# Altium project keyboard_V0.PrjPcb
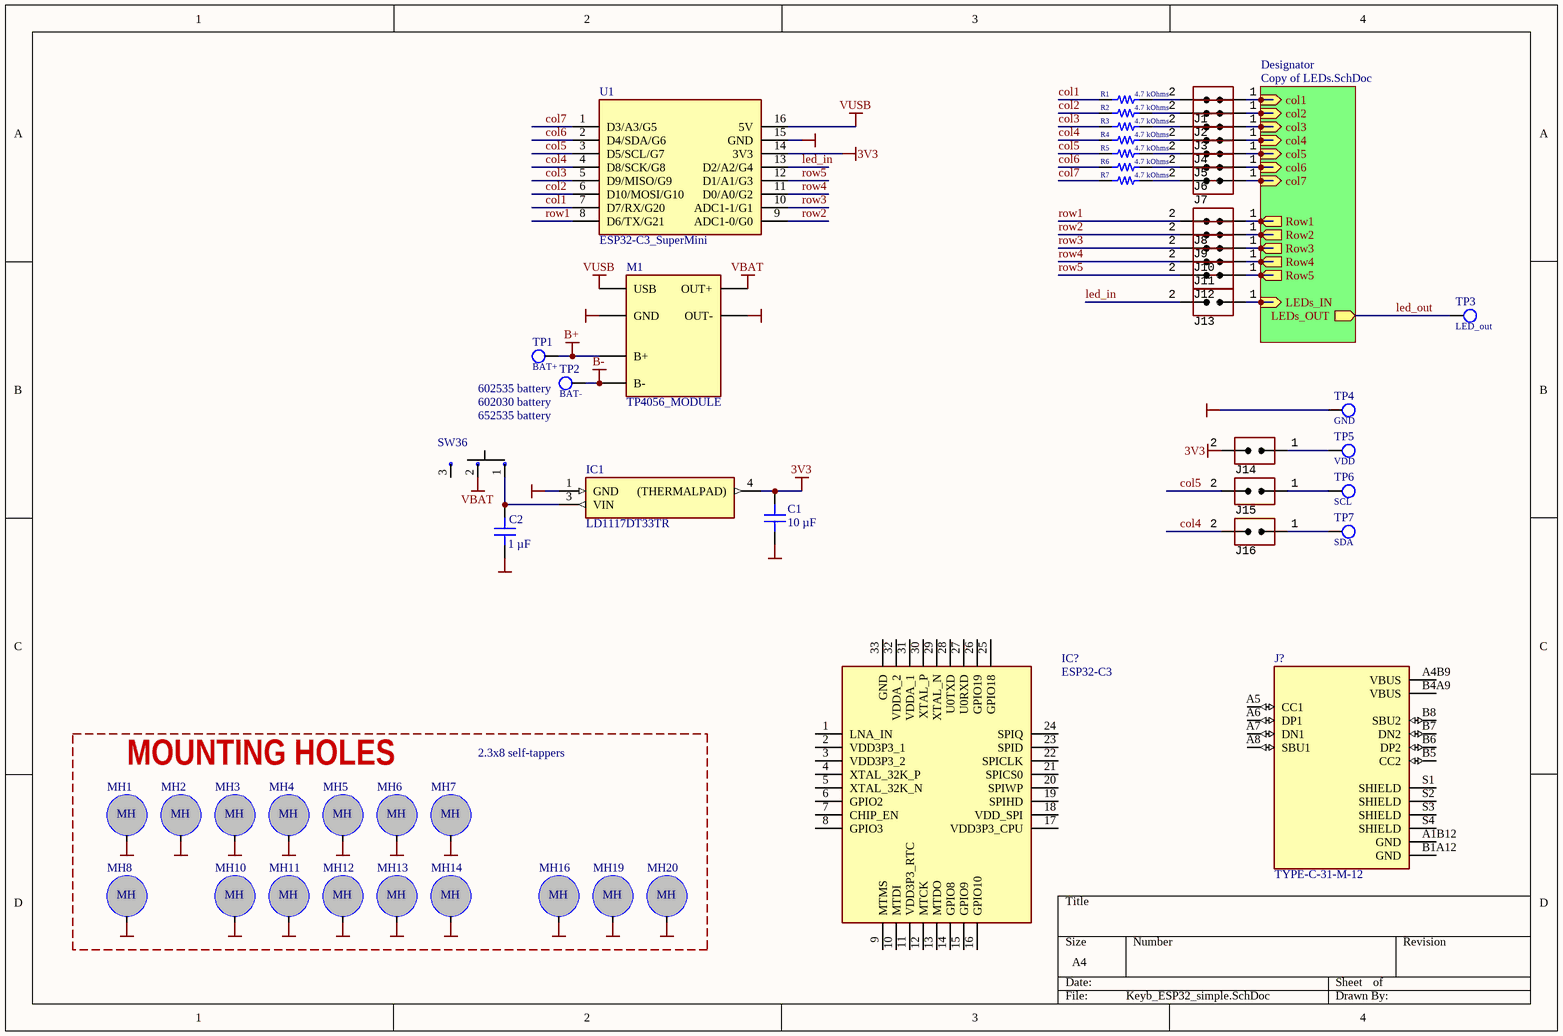
[diagram p0: Keyb_ESP32_simple.SchDoc]
2 sheets, 134 parts. Net scope: hierarchical (ports join the sheet entries above them; power ports are global).
Board file: Keyb_ESP32_simple.PcbDoc
Sheets:
  Keyb_ESP32_simple.SchDoc
    Designator = Copy of LEDs.SchDoc

## Sheet Keyb_ESP32_simple.SchDoc
size A4; SheetNumber: 1; SheetTotal: 2

### Parts
C1  10 µF  [CAP 0805_2012]
C2  1 µF  [CAP 0805_2012]
IC1  LD1117DT33TR  [TO228P972X240-3N]
IC?  ESP32-C3  [QFN50P500X500X90-33N-D]
J1  (no value)  [CON: JUMPER x1]
J2  (no value)  [CON: JUMPER x1]
J3  (no value)  [CON: JUMPER x1]
J4  (no value)  [CON: JUMPER x1]
J5  (no value)  [CON: JUMPER x1]
J6  (no value)  [CON: JUMPER x1]
J7  (no value)  [CON: JUMPER x1]
J8  (no value)  [CON: JUMPER x1]
J9  (no value)  [CON: JUMPER x1]
J10  (no value)  [CON: JUMPER x1]
J11  (no value)  [CON: JUMPER x1]
J12  (no value)  [CON: JUMPER x1]
J13  (no value)  [CON: JUMPER x1]
J14  (no value)  [CON: JUMPER x1]
J15  (no value)  [CON: JUMPER x1]
J16  (no value)  [CON: JUMPER x1]
J?  TYPE-C-31-M-12  [HRO_TYPE-C-31-M-12]
M1  TP4056_MODULE  [TP4056_MODULE]
MH1  MountingHole  [Hole_2.5mm]  (value not drawn)
MH2  MountingHole  [Hole_2.5mm]  (value not drawn)
MH3  MountingHole  [Hole_2.5mm]  (value not drawn)
MH4  MountingHole  [Hole_2.5mm]  (value not drawn)
MH5  MountingHole  [Hole_2.5mm]  (value not drawn)
MH6  MountingHole  [Hole_2.5mm]  (value not drawn)
MH7  MountingHole  [Hole_2.5mm]  (value not drawn)
MH8  MountingHole  [Hole_2.5mm]  (value not drawn)
MH10  MountingHole  [Hole_2.5mm]  (value not drawn)
MH11  MountingHole  [Hole_2.5mm]  (value not drawn)
MH12  MountingHole  [Hole_2.5mm]  (value not drawn)
MH13  MountingHole  [Hole_2.5mm]  (value not drawn)
MH14  MountingHole  [Hole_2.5mm]  (value not drawn)
MH16  MountingHole  [Hole_2.5mm]  (value not drawn)
MH19  MountingHole  [Hole_2.5mm]  (value not drawn)
MH20  MountingHole  [Hole_2.5mm]  (value not drawn)
R1  4.7 kOhms  [RES 0603_1608]
R2  4.7 kOhms  [RES 0603_1608]
R3  4.7 kOhms  [RES 0603_1608]
R4  4.7 kOhms  [RES 0603_1608]
R5  4.7 kOhms  [RES 0603_1608]
R6  4.7 kOhms  [RES 0603_1608]
R7  4.7 kOhms  [RES 0603_1608]
SW36  RockerSwitch_3mm  [SLIDE_SW_BIG]  (value not drawn)
TP1  BAT+  [TESTPOINT_PAD]
TP2  BAT-  [TESTPOINT_PAD]
TP3  LED_out  [TESTPOINT_PAD]
TP4  GND  [TESTPOINT_PAD]
TP5  VDD  [TESTPOINT_PAD]
TP6  SCL  [TESTPOINT_PAD]
TP7  SDA  [TESTPOINT_PAD]
U1  ESP32-C3_SuperMini  [ESP32-C3_SUPER_MINI]

### Blocks framed on the sheet
MOUNTING HOLES: MH1-MH8 MH10-MH14 MH16 MH19 MH20

### Sub-sheets
Designator = Copy of LEDs.SchDoc: col1 (in), col4 (in), col2 (in), col7 (in), col5 (in), col3 (in), col6 (in), Row5 (out), Row1 (out), Row2 (out), Row3 (out), Row4 (out), LEDs_IN (in), LEDs_OUT (out)

### Nets
3V3: C1.2 IC1.4((THERMALPAD)) J14.2(IN) U1.14(3V3)
B+: M1.B+ TP1.1
B-: M1.B- TP2.1
GND: C1.1 C2.1 IC1.1(GND) M1.GND M1.OUT- MH1.0 MH2.0 MH3.0 MH4.0 MH5.0 MH6.0 MH7.0 MH8.0 MH10.0 MH11.0 MH12.0 MH13.0 MH14.0 MH16.0 MH19.0 MH20.0 TP4.1 U1.15(GND)
VBAT: M1.OUT+ SW36.2
VUSB: M1.USB U1.16(5V)
col1: R1.2 U1.7(D7/RX/G20)
col2: R2.2 U1.6(D10/MOSI/G10)
col3: R3.2 U1.5(D9/MISO/G9)
col4: J16.2(IN) R4.2 U1.4(D8/SCK/G8)
col5: J15.2(IN) R5.2 U1.3(D5/SCL/G7)
col6: R6.2 U1.2(D4/SDA/G6)
col7: R7.2 U1.1(D3/A3/G5)
led_in: J13.2(IN) U1.13(D2/A2/G4)
led_out: TP3.1 ; sheet Designator/LEDs_OUT
row1: J8.2(IN) U1.8(D6/TX/G21)
row2: J9.2(IN) U1.9(ADC1-0/G0)
row3: J10.2(IN) U1.10(ADC1-1/G1)
row4: J11.2(IN) U1.11(D0/A0/G2)
row5: J12.2(IN) U1.12(D1/A1/G3)
NetC2_2: C2.2 IC1.3(VIN) SW36.1
NetD1_1: J8.1(IN) ; sheet Designator/Row1
NetD8_1: J9.1(IN) ; sheet Designator/Row2
NetD15_1: J10.1(IN) ; sheet Designator/Row3
NetD22_1: J11.1(IN) ; sheet Designator/Row4
NetD29_1: J12.1(IN) ; sheet Designator/Row5
NetJ1_1: J1.1(IN) ; sheet Designator/col1
NetJ1_2: J1.2(IN) R1.1
NetJ2_1: J2.1(IN) ; sheet Designator/col2
NetJ2_2: J2.2(IN) R2.1
NetJ3_1: J3.1(IN) ; sheet Designator/col3
NetJ3_2: J3.2(IN) R3.1
NetJ4_1: J4.1(IN) ; sheet Designator/col4
NetJ4_2: J4.2(IN) R4.1
NetJ5_1: J5.1(IN) ; sheet Designator/col5
NetJ5_2: J5.2(IN) R5.1
NetJ6_1: J6.1(IN) ; sheet Designator/col6
NetJ6_2: J6.2(IN) R6.1
NetJ7_1: J7.1(IN) ; sheet Designator/col7
NetJ7_2: J7.2(IN) R7.1
NetJ13_1: J13.1(IN) ; sheet Designator/LEDs_IN
NetJ14_1: J14.1(IN) TP5.1
NetJ15_1: J15.1(IN) TP6.1
NetJ16_1: J16.1(IN) TP7.1

Not connected (* = marked no-connect by the designer): IC? 1(LNA_IN) 2(VDD3P3_1) 3(VDD3P3_2) 4(XTAL_32K_P) 5(XTAL_32K_N) 6(GPIO2) 7(CHIP_EN) 8(GPIO3) 9(MTMS) 10(MTDI) 11(VDD3P3_RTC) 12(MTCK) 13(MTDO) 14(GPIO8) 15(GPIO9) 16(GPIO10) 17(VDD3P3_CPU) 18(VDD_SPI) 19(SPIHD) 20(SPIWP) 21(SPICS0) 22(SPICLK) 23(SPID) 24(SPIQ) 25(GPIO18) 26(GPIO19) 27(U0RXD) 28(U0TXD) 29(XTAL_N) 30(XTAL_P) 31(VDDA_1) 32(VDDA_2) 33(GND); J? A1B12(GND) A4B9(VBUS) A5(CC1) A6(DP1) A7(DN1) A8(SBU1) B1A12(GND) B4A9(VBUS) B5(CC2) B6(DP2) B7(DN2) B8(SBU2) S1(SHIELD) S2(SHIELD) S3(SHIELD) S4(SHIELD); SW36 3

### Notes on the sheet
- (near TP2) 602535 battery
- (near TP2) 602030 battery
- 652535 battery
- 2.3x8 self-tappers
- (in symbol MountingHole) MH

### Library data of the parts
C1 = C0805C106K8PAC7800: CAP CER 10UF 10V X5R 0805; manufacturer: KEMET; Tolerance: ±10%; Part Number: C0805C106K8PAC7800; Value: 10 µF; Applications: Bypass, Decoupling; Capacitance: 10 µF; componentlink1description: Datasheet; componentlink1url: https://connect.kemet.com:7667/gateway/IntelliData-ComponentDocumentation/1.0/download/datasheet/C0805C106K8PACTU; componentlink2description: DigiKey Link; componentlink2url: https://www.digikey.com/en/products/detail/kemet/C0805C106K8PAC7800/1090830; Device Package: 0805 (2012 Metric); lastupdated: 9/14/2022 7:51:56 AM; Lifecycle Status: Active; Minimum Order: 1; Mounting Type: Surface Mount, MLCC; Operating Temperature: -55°C ~ 85°C; Package / Case: 0805 (2012 Metric); packaging: TapeAndReel; partid: 44790; Part Status: Active; price: 0.02; series: SMD Comm X5R; Size / Dimension: 0.079" L x 0.049" W (2.00mm x 1.25mm); Supplier 1: DigiKey; Supplier Part Number 1: 399-C0805C106K8PAC7800CT-ND; Temperature Coefficient: X5R; Thickness (Max): 0.055" (1.40mm); Voltage - Rated: 10V
C2 = C0805C105K4RAC7800: CAP CER 1UF 16V X7R 0805; manufacturer: KEMET; Tolerance: ±10%; Part Number: C0805C105K4RAC7800; Value: 1 µF; Applications: Bypass, Decoupling; Capacitance: 1 µF; componentlink1description: Datasheet; componentlink1url: https://api.kemet.com/component-edge/download/datasheet/C0805C105K4RACTU.pdf; componentlink2description: DigiKey Link; componentlink2url: https://www.digikey.com/en/products/detail/kemet/C0805C105K4RAC7800/416047; Device Package: 0805 (2012 Metric); lastupdated: 9/19/2022 1:03:30 PM; Lifecycle Status: Active; Minimum Order: 1; Mounting Type: Surface Mount, MLCC; Operating Temperature: -55°C ~ 125°C; Package / Case: 0805 (2012 Metric); packaging: TapeAndReel; partid: 32075; Part Status: Active; price: 0.01; series: SMD Comm X7R; Size / Dimension: 0.079" L x 0.049" W (2.00mm x 1.25mm); Supplier 1: DigiKey; Supplier Part Number 1: 399-C0805C105K4RAC7800CT-ND; Temperature Coefficient: X7R; Thickness (Max): 0.039" (1.00mm); Voltage - Rated: 16V
IC1 = LD1117DT33TR: Integrated Circuit; Manufacturer_Name: STMicroelectronics; Datasheet Link: http://www.st.com/web/en/resource/technical/document/datasheet/CD00000544.pdf; Height: 2.4mm; Manufacturer_Part_Number: LD1117DT33TR; Mouser Part Number: 511-LD1117DT33-TR; Mouser Price/Stock: https://www.mouser.co.uk/ProductDetail/STMicroelectronics/LD1117DT33TR?qs=4JhUBQGAOSd4P5jVYGxp2g%3D%3D; Arrow Part Number: LD1117DT33TR; Arrow Price/Stock: https://www.arrow.com/en/products/ld1117dt33tr/stmicroelectronics?region=nac
IC? = ESP32-C3: Integrated Circuit; Manufacturer_Name: Espressif Systems; Datasheet Link: https://www.espressif.com/sites/default/files/documentation/esp32-c3_datasheet_en.pdf; Height: 0.9mm; Manufacturer_Part_Number: ESP32-C3; Mouser Part Number: 356-ESP32-C3; Mouser Price/Stock: https://www.mouser.co.uk/ProductDetail/Espressif-Systems/ESP32-C3?qs=iLbezkQI%252BsiMXe7tMG%252Bo%2FA%3D%3D
J1-J16 = Jumper_single: CommentText: "Перемычка"
J? = TYPE-C-31-M-12: USB Connectors 24 Receptacle 1 8.94*7.3mm RoHS; MF: {'manufacturer': u'HRO Electronics Co., Ltd.'}; Package: None; Price: None; Value: *; MP: TYPE-C-31-M-12; Availability: Unavailable
R1-R7 = ERJ-U03J472V: RES 4.7K OHM 5% 1/10W 0603 SMD; Manufacturer: Panasonic Electronic Components; Power (Watts): 0.1W, 1/10W; Temperature Coefficient: ±200ppm/°C; Part Number: ERJ-U03J472V; Value: 4.7 kOhms; ComponentLink1Description: Datasheet; ComponentLink1URL: https://industrial.panasonic.com/cdbs/www-data/pdf/RDP0000/AOA0000C334.pdf; ComponentLink2Description: DigiKey Link; ComponentLink2URL: https://www.digikey.com/en/products/detail/panasonic-electronic-components/ERJ-U03J472V/11631906; Composition: Thick Film; Device Package: 0603 (1608 Metric); Features: Anti-Sulfur, Automotive AEC-Q200; Height - Seated (Max): 0.022" (0.55mm); LastUpdated: 2/9/2024 8:41:20 PM; Lifecycle Status: Active; Minimum Order: 1; Number of Terminations: 2; Operating Temperature: -55°C ~ 155°C; Package / Case: 0603 (1608 Metric); Packaging: TapeAndReel; PartId: 62126; Part Status: Active; Price: 0.01; Ratings: AEC-Q200; Resistance: 4.7 kOhms; Series: ERJ-U03; Size / Dimension: 0.063" L x 0.031" W (1.60mm x 0.80mm); Supplier 1: DigiKey; Supplier Part Number 1: 10-ERJ-U03J472VCT-ND; Supplier Device Package: 0603; Tolerance: ±5%
SW36 = RockerSwitch_3mm: Slide switch L-KLS7-SS-12F19-G5
TP1-TP7 = TestPoint

## Sheet Copy of LEDs.SchDoc
size A2; SheetNumber: 2; SheetTotal: 2
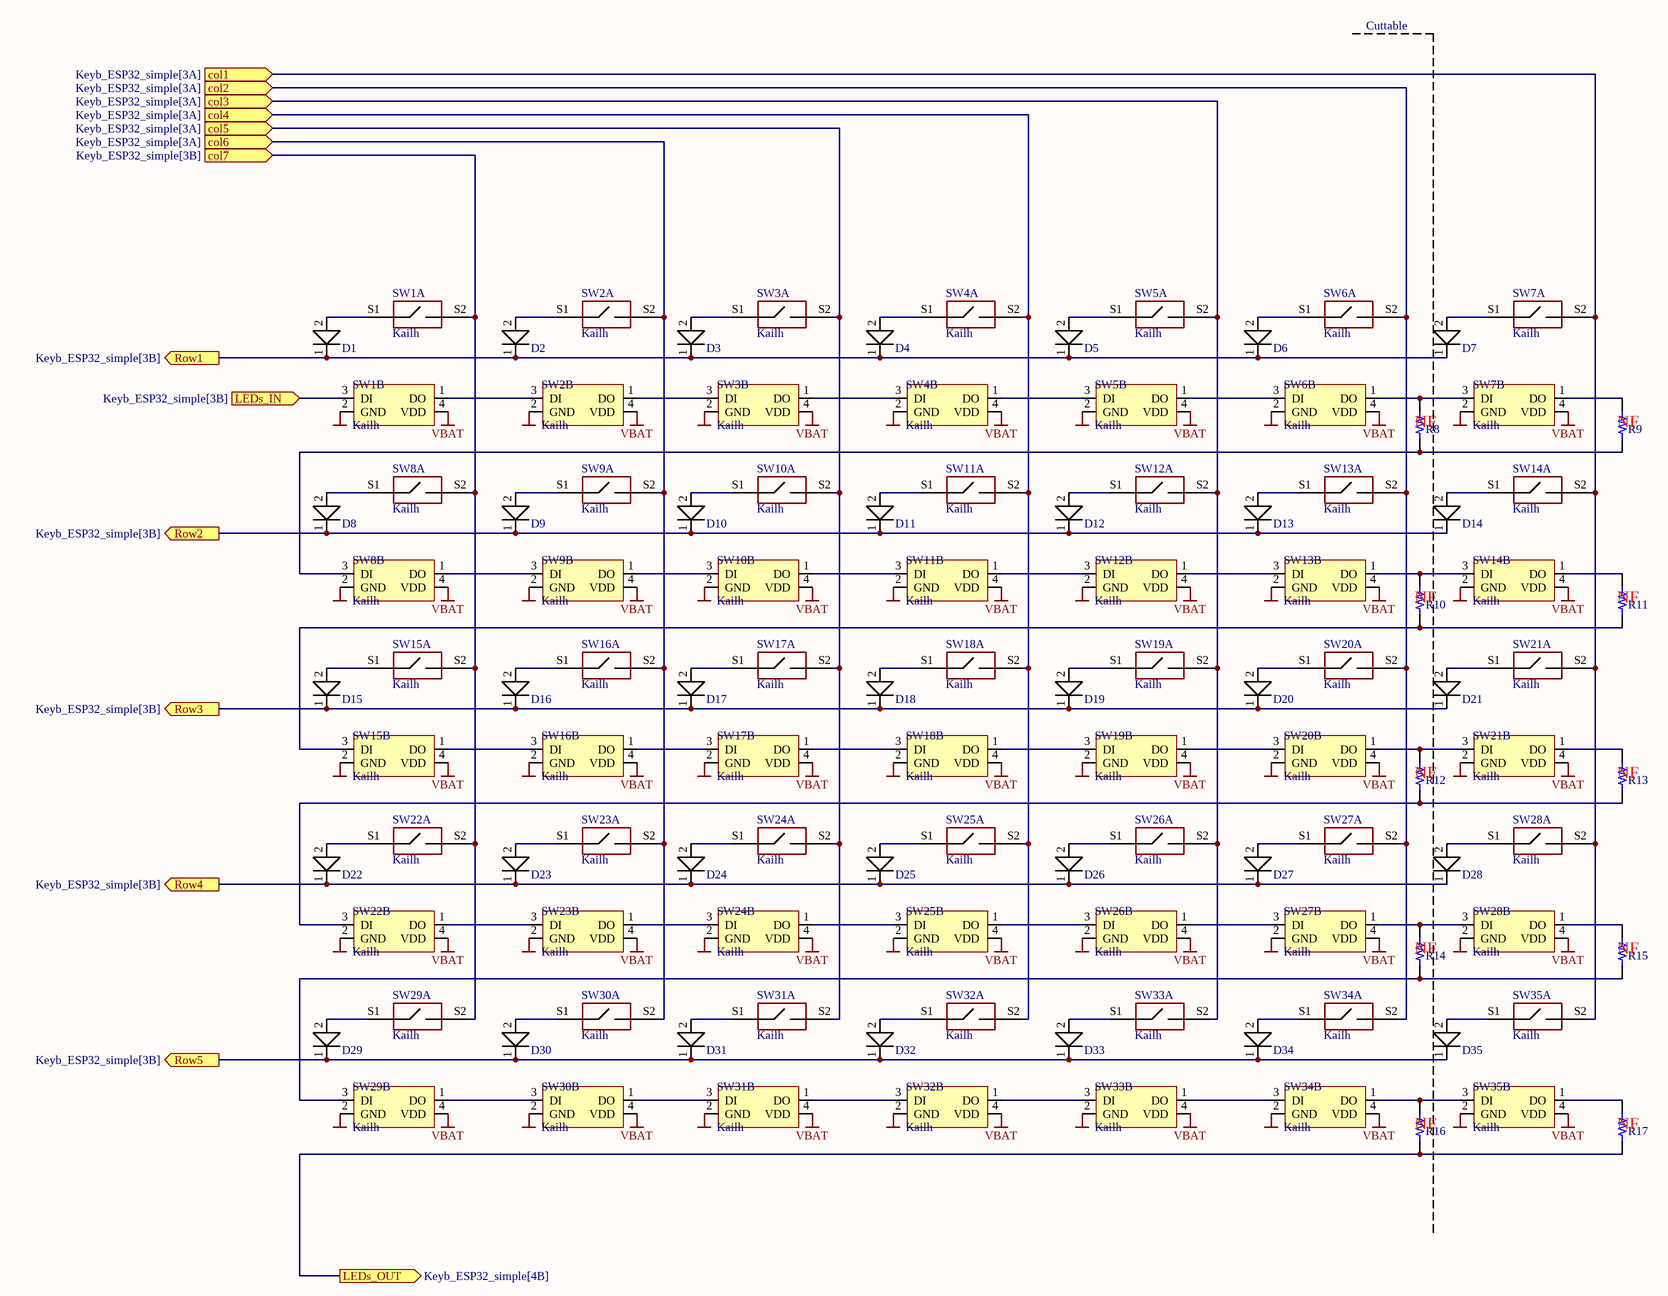
[diagram p1: Copy of LEDs.SchDoc]

### Parts
D1  1N4148  [SOD-123]  (value not drawn)
D2  1N4148  [SOD-123]  (value not drawn)
D3  1N4148  [SOD-123]  (value not drawn)
D4  1N4148  [SOD-123]  (value not drawn)
D5  1N4148  [SOD-123]  (value not drawn)
D6  1N4148  [SOD-123]  (value not drawn)
D7  1N4148  [SOD-123]  (value not drawn)
D8  1N4148  [SOD-123]  (value not drawn)
D9  1N4148  [SOD-123]  (value not drawn)
D10  1N4148  [SOD-123]  (value not drawn)
D11  1N4148  [SOD-123]  (value not drawn)
D12  1N4148  [SOD-123]  (value not drawn)
D13  1N4148  [SOD-123]  (value not drawn)
D14  1N4148  [SOD-123]  (value not drawn)
D15  1N4148  [SOD-123]  (value not drawn)
D16  1N4148  [SOD-123]  (value not drawn)
D17  1N4148  [SOD-123]  (value not drawn)
D18  1N4148  [SOD-123]  (value not drawn)
D19  1N4148  [SOD-123]  (value not drawn)
D20  1N4148  [SOD-123]  (value not drawn)
D21  1N4148  [SOD-123]  (value not drawn)
D22  1N4148  [SOD-123]  (value not drawn)
D23  1N4148  [SOD-123]  (value not drawn)
D24  1N4148  [SOD-123]  (value not drawn)
D25  1N4148  [SOD-123]  (value not drawn)
D26  1N4148  [SOD-123]  (value not drawn)
D27  1N4148  [SOD-123]  (value not drawn)
D28  1N4148  [SOD-123]  (value not drawn)
D29  1N4148  [SOD-123]  (value not drawn)
D30  1N4148  [SOD-123]  (value not drawn)
D31  1N4148  [SOD-123]  (value not drawn)
D32  1N4148  [SOD-123]  (value not drawn)
D33  1N4148  [SOD-123]  (value not drawn)
D34  1N4148  [SOD-123]  (value not drawn)
D35  1N4148  [SOD-123]  (value not drawn)
R8  (no value)  [RES 0603_1608]
R9  (no value)  [RES 0603_1608]
R10  (no value)  [RES 0603_1608]
R11  (no value)  [RES 0603_1608]
R12  (no value)  [RES 0603_1608]
R13  (no value)  [RES 0603_1608]
R14  (no value)  [RES 0603_1608]
R15  (no value)  [RES 0603_1608]
R16  (no value)  [RES 0603_1608]
R17  (no value)  [RES 0603_1608]
SW1  Kailh  [KAILH_MX_SOCKET_WS2812]  (parts A,B of 2)
SW2  Kailh  [KAILH_MX_SOCKET_WS2812]  (parts A,B of 2)
SW3  Kailh  [KAILH_MX_SOCKET_WS2812]  (parts A,B of 2)
SW4  Kailh  [KAILH_MX_SOCKET_WS2812]  (parts A,B of 2)
SW5  Kailh  [KAILH_MX_SOCKET_WS2812]  (parts A,B of 2)
SW6  Kailh  [KAILH_MX_SOCKET_WS2812]  (parts A,B of 2)
SW7  Kailh  [KAILH_MX_SOCKET_WS2812]  (parts A,B of 2)
SW8  Kailh  [KAILH_MX_SOCKET_WS2812]  (parts A,B of 2)
SW9  Kailh  [KAILH_MX_SOCKET_WS2812]  (parts A,B of 2)
SW10  Kailh  [KAILH_MX_SOCKET_WS2812]  (parts A,B of 2)
SW11  Kailh  [KAILH_MX_SOCKET_WS2812]  (parts A,B of 2)
SW12  Kailh  [KAILH_MX_SOCKET_WS2812]  (parts A,B of 2)
SW13  Kailh  [KAILH_MX_SOCKET_WS2812]  (parts A,B of 2)
SW14  Kailh  [KAILH_MX_SOCKET_WS2812]  (parts A,B of 2)
SW15  Kailh  [KAILH_MX_SOCKET_WS2812]  (parts A,B of 2)
SW16  Kailh  [KAILH_MX_SOCKET_WS2812]  (parts A,B of 2)
SW17  Kailh  [KAILH_MX_SOCKET_WS2812]  (parts A,B of 2)
SW18  Kailh  [KAILH_MX_SOCKET_WS2812]  (parts A,B of 2)
SW19  Kailh  [KAILH_MX_SOCKET_WS2812]  (parts A,B of 2)
SW20  Kailh  [KAILH_MX_SOCKET_WS2812]  (parts A,B of 2)
SW21  Kailh  [KAILH_MX_SOCKET_WS2812]  (parts A,B of 2)
SW22  Kailh  [KAILH_MX_SOCKET_WS2812]  (parts A,B of 2)
SW23  Kailh  [KAILH_MX_SOCKET_WS2812]  (parts A,B of 2)
SW24  Kailh  [KAILH_MX_SOCKET_WS2812]  (parts A,B of 2)
SW25  Kailh  [KAILH_MX_SOCKET_WS2812]  (parts A,B of 2)
SW26  Kailh  [KAILH_MX_SOCKET_WS2812]  (parts A,B of 2)
SW27  Kailh  [KAILH_MX_SOCKET_WS2812]  (parts A,B of 2)
SW28  Kailh  [KAILH_MX_SOCKET_WS2812]  (parts A,B of 2)
SW29  Kailh  [KAILH_MX_SOCKET_WS2812]  (parts A,B of 2)
SW30  Kailh  [KAILH_MX_SOCKET_WS2812]  (parts A,B of 2)
SW31  Kailh  [KAILH_MX_SOCKET_WS2812]  (parts A,B of 2)
SW32  Kailh  [KAILH_MX_SOCKET_WS2812]  (parts A,B of 2)
SW33  Kailh  [KAILH_MX_SOCKET_WS2812]  (parts A,B of 2)
SW34  Kailh  [KAILH_MX_SOCKET_WS2812]  (parts A,B of 2)
SW35  Kailh  [KAILH_MX_SOCKET_WS2812]  (parts A,B of 2)

### Ports
col1 (in, see Keyb_ESP32_simple[3A]), col2 (in, see Keyb_ESP32_simple[3A]), col3 (in, see Keyb_ESP32_simple[3A]), col4 (in, see Keyb_ESP32_simple[3A]), col5 (in, see Keyb_ESP32_simple[3A]), col6 (in, see Keyb_ESP32_simple[3A]), col7 (in, see Keyb_ESP32_simple[3B]), LEDs_IN (in, see Keyb_ESP32_simple[3B]), LEDs_OUT (out, see Keyb_ESP32_simple[4B]), Row1 (out, see Keyb_ESP32_simple[3B]), Row2 (out, see Keyb_ESP32_simple[3B]), Row3 (out, see Keyb_ESP32_simple[3B]), Row4 (out, see Keyb_ESP32_simple[3B]), Row5 (out, see Keyb_ESP32_simple[3B])

### Nets
GND: SW1.2(GND) SW2.2(GND) SW3.2(GND) SW4.2(GND) SW5.2(GND) SW6.2(GND) SW7.2(GND) SW8.2(GND) SW9.2(GND) SW10.2(GND) SW11.2(GND) SW12.2(GND) SW13.2(GND) SW14.2(GND) SW15.2(GND) SW16.2(GND) SW17.2(GND) SW18.2(GND) SW19.2(GND) SW20.2(GND) SW21.2(GND) SW22.2(GND) SW23.2(GND) SW24.2(GND) SW25.2(GND) SW26.2(GND) SW27.2(GND) SW28.2(GND) SW29.2(GND) SW30.2(GND) SW31.2(GND) SW32.2(GND) SW33.2(GND) SW34.2(GND) SW35.2(GND)
VBAT: SW1.4(VDD) SW2.4(VDD) SW3.4(VDD) SW4.4(VDD) SW5.4(VDD) SW6.4(VDD) SW7.4(VDD) SW8.4(VDD) SW9.4(VDD) SW10.4(VDD) SW11.4(VDD) SW12.4(VDD) SW13.4(VDD) SW14.4(VDD) SW15.4(VDD) SW16.4(VDD) SW17.4(VDD) SW18.4(VDD) SW19.4(VDD) SW20.4(VDD) SW21.4(VDD) SW22.4(VDD) SW23.4(VDD) SW24.4(VDD) SW25.4(VDD) SW26.4(VDD) SW27.4(VDD) SW28.4(VDD) SW29.4(VDD) SW30.4(VDD) SW31.4(VDD) SW32.4(VDD) SW33.4(VDD) SW34.4(VDD) SW35.4(VDD)
led_out: R16.2 R17.2 ; port LEDs_OUT
NetD1_1: D1.1(S8) D2.1(S8) D3.1(S8) D4.1(S8) D5.1(S8) D6.1(S8) D7.1(S8) ; port Row1
NetD1_2: D1.2(S7) SW1.S1
NetD2_2: D2.2(S7) SW2.S1
NetD3_2: D3.2(S7) SW3.S1
NetD4_2: D4.2(S7) SW4.S1
NetD5_2: D5.2(S7) SW5.S1
NetD6_2: D6.2(S7) SW6.S1
NetD7_2: D7.2(S7) SW7.S1
NetD8_1: D8.1(S8) D9.1(S8) D10.1(S8) D11.1(S8) D12.1(S8) D13.1(S8) D14.1(S8) ; port Row2
NetD8_2: D8.2(S7) SW8.S1
NetD9_2: D9.2(S7) SW9.S1
NetD10_2: D10.2(S7) SW10.S1
NetD11_2: D11.2(S7) SW11.S1
NetD12_2: D12.2(S7) SW12.S1
NetD13_2: D13.2(S7) SW13.S1
NetD14_2: D14.2(S7) SW14.S1
NetD15_1: D15.1(S8) D16.1(S8) D17.1(S8) D18.1(S8) D19.1(S8) D20.1(S8) D21.1(S8) ; port Row3
NetD15_2: D15.2(S7) SW15.S1
NetD16_2: D16.2(S7) SW16.S1
NetD17_2: D17.2(S7) SW17.S1
NetD18_2: D18.2(S7) SW18.S1
NetD19_2: D19.2(S7) SW19.S1
NetD20_2: D20.2(S7) SW20.S1
NetD21_2: D21.2(S7) SW21.S1
NetD22_1: D22.1(S8) D23.1(S8) D24.1(S8) D25.1(S8) D26.1(S8) D27.1(S8) D28.1(S8) ; port Row4
NetD22_2: D22.2(S7) SW22.S1
NetD23_2: D23.2(S7) SW23.S1
NetD24_2: D24.2(S7) SW24.S1
NetD25_2: D25.2(S7) SW25.S1
NetD26_2: D26.2(S7) SW26.S1
NetD27_2: D27.2(S7) SW27.S1
NetD28_2: D28.2(S7) SW28.S1
NetD29_1: D29.1(S8) D30.1(S8) D31.1(S8) D32.1(S8) D33.1(S8) D34.1(S8) D35.1(S8) ; port Row5
NetD29_2: D29.2(S7) SW29.S1
NetD30_2: D30.2(S7) SW30.S1
NetD31_2: D31.2(S7) SW31.S1
NetD32_2: D32.2(S7) SW32.S1
NetD33_2: D33.2(S7) SW33.S1
NetD34_2: D34.2(S7) SW34.S1
NetD35_2: D35.2(S7) SW35.S1
NetJ1_1: SW7.S2 SW14.S2 SW21.S2 SW28.S2 SW35.S2 ; port col1
NetJ2_1: SW6.S2 SW13.S2 SW20.S2 SW27.S2 SW34.S2 ; port col2
NetJ3_1: SW5.S2 SW12.S2 SW19.S2 SW26.S2 SW33.S2 ; port col3
NetJ4_1: SW4.S2 SW11.S2 SW18.S2 SW25.S2 SW32.S2 ; port col4
NetJ5_1: SW3.S2 SW10.S2 SW17.S2 SW24.S2 SW31.S2 ; port col5
NetJ6_1: SW2.S2 SW9.S2 SW16.S2 SW23.S2 SW30.S2 ; port col6
NetJ7_1: SW1.S2 SW8.S2 SW15.S2 SW22.S2 SW29.S2 ; port col7
NetJ13_1: SW1.3(DI) ; port LEDs_IN
NetR8_1: R8.1 SW6.1(DO) SW7.3(DI)
NetR8_2: R8.2 R9.2 SW8.3(DI)
NetR9_1: R9.1 SW7.1(DO)
NetR10_1: R10.1 SW13.1(DO) SW14.3(DI)
NetR10_2: R10.2 R11.2 SW15.3(DI)
NetR11_1: R11.1 SW14.1(DO)
NetR12_1: R12.1 SW20.1(DO) SW21.3(DI)
NetR12_2: R12.2 R13.2 SW22.3(DI)
NetR13_1: R13.1 SW21.1(DO)
NetR14_1: R14.1 SW27.1(DO) SW28.3(DI)
NetR14_2: R14.2 R15.2 SW29.3(DI)
NetR15_1: R15.1 SW28.1(DO)
NetR16_1: R16.1 SW34.1(DO) SW35.3(DI)
NetR17_1: R17.1 SW35.1(DO)
NetSW1_1: SW1.1(DO) SW2.3(DI)
NetSW2_1: SW2.1(DO) SW3.3(DI)
NetSW3_1: SW3.1(DO) SW4.3(DI)
NetSW4_1: SW4.1(DO) SW5.3(DI)
NetSW5_1: SW5.1(DO) SW6.3(DI)
NetSW8_1: SW8.1(DO) SW9.3(DI)
NetSW9_1: SW9.1(DO) SW10.3(DI)
NetSW10_1: SW10.1(DO) SW11.3(DI)
NetSW11_1: SW11.1(DO) SW12.3(DI)
NetSW12_1: SW12.1(DO) SW13.3(DI)
NetSW15_1: SW15.1(DO) SW16.3(DI)
NetSW16_1: SW16.1(DO) SW17.3(DI)
NetSW17_1: SW17.1(DO) SW18.3(DI)
NetSW18_1: SW18.1(DO) SW19.3(DI)
NetSW19_1: SW19.1(DO) SW20.3(DI)
NetSW22_1: SW22.1(DO) SW23.3(DI)
NetSW23_1: SW23.1(DO) SW24.3(DI)
NetSW24_1: SW24.1(DO) SW25.3(DI)
NetSW25_1: SW25.1(DO) SW26.3(DI)
NetSW26_1: SW26.1(DO) SW27.3(DI)
NetSW29_1: SW29.1(DO) SW30.3(DI)
NetSW30_1: SW30.1(DO) SW31.3(DI)
NetSW31_1: SW31.1(DO) SW32.3(DI)
NetSW32_1: SW32.1(DO) SW33.3(DI)
NetSW33_1: SW33.1(DO) SW34.3(DI)

### Notes on the sheet
- Cuttable
- (near R8) NF
- (near R9) NF
- (near R10) NF
- (near R11) NF
- (near R12) NF
- (near R13) NF
- (near R14) NF
- (near R15) NF
- (near R16) NF
- (near R17) NF

### Library data of the parts
R8-R17 = RCA06030000ZSEA: RES SMD 0 OHM JUMPER 1/10W 0603; Manufacturer: Vishay Dale; Power (Watts): 0.1W, 1/10W; Part Number: RCA06030000ZSEA; ComponentLink1Description: Datasheet; ComponentLink1URL: http://www.vishay.com/docs/20037/rcae3.pdf; ComponentLink2Description: DigiKey Link; ComponentLink2URL: http://digikey.com/product-detail/en/vishay-dale/RCA06030000ZSEA/541-2192-1-ND/4946845; Composition: Thick Film; Device Package: 0603 (1608 Metric); Features: Anti-Sulfur, Automotive AEC-Q200; Height - Seated (Max): 0.020" (0.50mm); LastUpdated: 9/2/2020 1:10:23 AM; Lifecycle Status: Active; Minimum Order: 1; Number of Terminations: 2; Operating Temperature: -55°C ~ 155°C; Package / Case: 0603 (1608 Metric); Packaging: TapeAndReel; PartId: 5740; Part Status: Active; Price: 0.01; Ratings: AEC-Q200; Series: RCA; Size / Dimension: 0.061" L x 0.033" W (1.55mm x 0.85mm); Supplier 1: DigiKey; Supplier Part Number 1: 541-2192-1-ND; Supplier Device Package: 0603; Tolerance: Jumper
SW1-SW35 = Kailh_hotswap_RGB_WS2812: Kailh keyboard switch, hotswap rgb ws2812 in 2020 package, dual-side hotswap options + low prifile variant

## Nets that join several sheets
GND: Keyb_ESP32_simple (23 pins), Copy of LEDs (35 pins)
VBAT: Keyb_ESP32_simple (M1.OUT+ SW36.2), Copy of LEDs (35 pins)
led_out: Keyb_ESP32_simple (TP3.1), Copy of LEDs (R16.2 R17.2)
NetD1_1: Keyb_ESP32_simple (J8.1), Copy of LEDs (7 pins)
NetD8_1: Keyb_ESP32_simple (J9.1), Copy of LEDs (7 pins)
NetD15_1: Keyb_ESP32_simple (J10.1), Copy of LEDs (7 pins)
NetD22_1: Keyb_ESP32_simple (J11.1), Copy of LEDs (7 pins)
NetD29_1: Keyb_ESP32_simple (J12.1), Copy of LEDs (7 pins)
NetJ1_1: Keyb_ESP32_simple (J1.1), Copy of LEDs (5 pins)
NetJ2_1: Keyb_ESP32_simple (J2.1), Copy of LEDs (5 pins)
NetJ3_1: Keyb_ESP32_simple (J3.1), Copy of LEDs (5 pins)
NetJ4_1: Keyb_ESP32_simple (J4.1), Copy of LEDs (5 pins)
NetJ5_1: Keyb_ESP32_simple (J5.1), Copy of LEDs (5 pins)
NetJ6_1: Keyb_ESP32_simple (J6.1), Copy of LEDs (5 pins)
NetJ7_1: Keyb_ESP32_simple (J7.1), Copy of LEDs (5 pins)
NetJ13_1: Keyb_ESP32_simple (J13.1), Copy of LEDs (SW1.3)